# EasyEDA Pro project 物联网底板.eprj, board PCB4
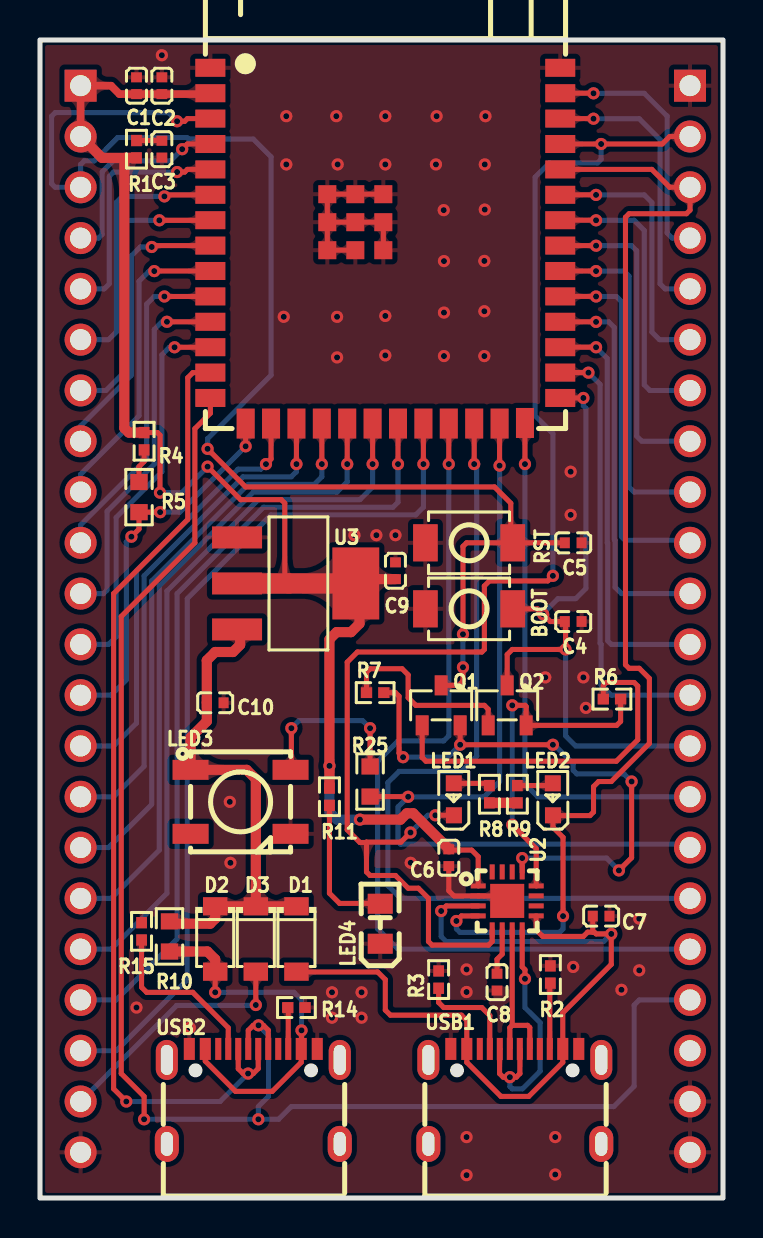
[diagram p4: board, top side]
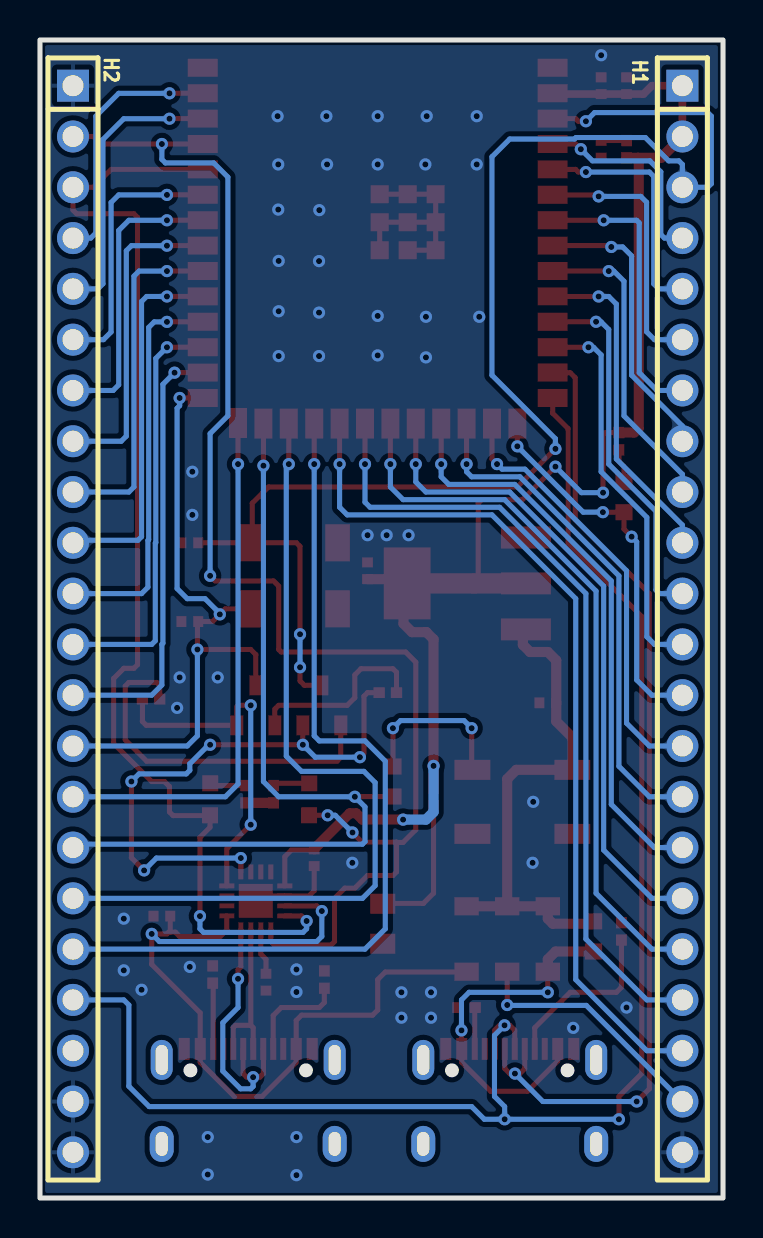
[diagram p5: board, bottom side, seen from below]

Outline 34.16 x 57.91 mm; copper layers: Top Layer, Bottom Layer. Coordinates in mm from the lower left corner of the outline.
Outline path: rectangle 0,57.91 34.16,0
Stack: Top Layer 0.035mm / Dielectric1 1.51mm FR4 er 4.5 / Bottom Layer 0.035mm

## Design rules (mm)
template: JLCPCB Capability(Two Layers Board)
spacing copperThickness1oz (default): track to track 0.102, other pairs 0.152 to 0.3
spacing copperThickness2oz: track to track 0.203, other pairs 0.152 to 0.3
track width copperThickness1oz (default): min 0.127, default 0.254, max 2.54
track width copperThickness2oz: min 0.203, default 0.254, max 2.54
differential pair differentialPair (default): width min 0.127, default 0.254, max 2.54; gap min 0.152, default 0.152
via viaSize (default): diameter min 0.5, default 0.61, max 10; hole min 0.3, default 0.305, max 6.3

## Placement (name value [footprint] x y rotation side)
BOOT  TS-1088-AR02016  [SW-SMD_L3.9-W3.0-P4.45]  21.46 29.46 0 top
C1  10uF  [C0402]  4.83 55.63 270 top
C2  100nF  [C0402]  6.1 55.63 270 top
C3  1uF  [C0402]  6.1 52.45 90 top
C4  100nF  [C0402]  26.67 28.83 180 top
C5  100nF  [C0402]  26.67 32.77 180 top
C6  1uF  [C0402]  20.45 17.02 270 top
C7  1uF  [C0402]  28.07 14.1 180 top
C8  100nF  [C0402]  22.86 10.79 90 top
C9  10uF  [C0402]  17.78 31.37 90 top
C10  10uF  [C0402]  8.76 24.76 180 top
D1  BZT52C12  [SOD-123_L2.7-W1.6-LS3.7-RD]  12.83 12.95 270 top
D2  BZT52C12  [SOD-123_L2.7-W1.6-LS3.7-RD]  8.76 12.95 270 top
D3  BZT52C12  [SOD-123_L2.7-W1.6-LS3.7-RD]  10.79 12.95 270 top
H1  HC-PZ254-11.5L-1x22PZ  [HDR-TH_22P-P2.54-V-M]  2.03 28.96 270 bottom
H2  HC-PZ254-11.5L-1x22PZ  [HDR-TH_22P-P2.54-V-M]  32.51 28.96 270 bottom
LED1  XL-1608UWC-04  [LED0603-RD_WHITE]  20.7 19.94 90 top
LED2  XL-1608UWC-04  [LED0603-RD_WHITE]  25.65 19.94 90 top
LED3  WS2812B-V5/W  [LED-SMD_4P-L5.0-W5.0-TL-1]  10.03 19.81 0 top
LED4  XL-2012SURC  [LED0805-RD_RED]  17.02 13.72 90 top
Q1  SS8050-G(RANGE:120-200)  [SOT-23-3_L2.9-W1.3-P1.90-LS2.4-BR]  20.07 24.64 270 top
Q2  SS8050-G(RANGE:120-200)  [SOT-23-3_L2.9-W1.3-P1.90-LS2.4-BR]  23.37 24.64 270 top
R1  10kΩ  [R0402]  4.83 52.45 270 top
R2  5.1kΩ  [R0402]  25.53 11.18 90 top
R3  5.1kΩ  [R0402]  19.94 10.92 90 top
R4  10kΩ  [R0402]  5.21 37.85 90 top
R5  0Ω  [R0603]  4.95 35.05 90 top
R6  10kΩ  [R0402]  28.61 24.95 0 top
R7  10kΩ  [R0402]  16.76 25.27 0 top
R8  1kΩ  [R0402]  22.48 20.19 270 top
R9  1kΩ  [R0402]  23.88 20.19 270 top
R10  0Ω  [R0603]  6.48 13.08 270 top
R11  1kΩ  [R0402]  14.48 20.07 270 top
R14  5.1kΩ  [R0402]  12.83 9.52 0 top
R15  5.1kΩ  [R0402]  5.08 13.33 90 top
R25  0Ω  [R0603]  16.51 20.83 270 top
RST  TS-1088-AR02016  [SW-SMD_L3.9-W3.0-P4.45]  21.46 32.77 0 top
U1  2.4GHz  [WIRELM-SMD_ESP32-S3-WROOM-1]  17.27 47.62 0 top
U2  CH343P  [TQFN-16_L3.0-W3.0-P0.50-BL-EP1.7]  23.37 14.86 270 top
U3  CJ6109A33GW  [SOT-223-3_L6.5-W3.4-P2.30-LS7.0-BR]  12.83 30.73 180 top
USB1  TYPE-C 16PIN 2MD(073)  [USB-C-SMD_TYPE-C-16PIN-2MD-073]  23.75 5.08 0 top
USB2  TYPE-C 16PIN 2MD(073)  [USB-C-SMD_TYPE-C-16PIN-2MD-073]  10.67 5.08 0 top

## Footprints (pads in the part's own frame, mm; a bottom-side part is the same pattern mirrored in y, then rotated)
C0402
  rect 0.5x0.54 smd: 1(-0.42,0) 2(0.42,0)
HDR-TH_22P-P2.54-V-M
  rect 1.6x1.6 hole 1.05: 1(-26.67,0)
  round 1.6 hole 1.05: 2(-24.13,0) 3(-21.59,0) 4(-19.05,0) 5(-16.51,0) 6(-13.97,0) 7(-11.43,0) 8(-8.89,0) 9(-6.35,0) 10(-3.81,0) 11(-1.27,0) 12(1.27,0) 13(3.81,0) 14(6.35,0) 15(8.89,0) 16(11.43,0) 17(13.97,0) 18(16.51,0) 19(19.05,0) 20(21.59,0) 21(24.13,0) 22(26.67,0)
LED0603-RD_WHITE
  rect 0.8x0.8 smd: 1(-0.799,-0.004) 2(0.799,0.004)
LED0805-RD_RED
  rect 1x1.25 smd: 1(-1,0) 2(1,0)
LED-SMD_4P-L5.0-W5.0-TL-1
  rect 1.8x1 smd: 1(-2.5,1.6) 2(-2.5,-1.6) 3(2.5,-1.6) 4(2.5,1.6)
R0402
  rect 0.566x0.54 smd: 1(-0.433,0) 2(0.433,0)
R0603
  rect 0.806x0.864 smd: 1(-0.753,0) 2(0.753,0)
SOD-123_L2.7-W1.6-LS3.7-RD
  rect 0.91x1.22 smd: 1(-1.635,0) 2(1.635,0)
SOT-23-3_L2.9-W1.3-P1.90-LS2.4-BR
  rect 1x0.65 smd: 1(1,-0.95) 2(1,0.95) 3(-1,0)
SOT-223-3_L6.5-W3.4-P2.30-LS7.0-BR
  rect 2.5x1.1 smd: 1(2.97,-2.3) 2(2.97,0) 3(2.97,2.3)
  rect 2.34x3.6 smd: 4(-2.97,0)
SW-SMD_L3.9-W3.0-P4.45
  rect 1.23x1.86 smd: 1(-2.185,0) 2(2.185,0)
TQFN-16_L3.0-W3.0-P0.50-BL-EP1.7
  rect 0.25x0.75 smd: 1(-0.749,-1.45) 2(-0.248,-1.45) 3(0.252,-1.45) 4(0.751,-1.45) 9(0.75,1.45) 10(0.25,1.45) 11(-0.25,1.45) 12(-0.749,1.45)
  rect 0.75x0.25 smd: 5(1.45,-0.75) 6(1.45,-0.25) 7(1.45,0.25) 8(1.45,0.75) 13(-1.45,0.75) 14(-1.45,0.25) 15(-1.45,-0.25) 16(-1.45,-0.75)
  rect 1.7x1.7 smd: 17(0.001,0)
USB-C-SMD_TYPE-C-16PIN-2MD-073
  oval 1.1x2 hole 0.6x1.5: 13(-4.325,1.825) 14(4.325,1.825)
  oval 1.2x1.8 hole 0.6x1.2: 13(-4.325,-2.375) 14(4.325,-2.375)
  rect 0.55x1.1 smd: A1B12(-3.2,2.375) A4B9(-2.4,2.375) B1A12(3.2,2.375) B4A9(2.4,2.375)
  rect 0.3x1.1 smd: A5(-1.25,2.375) A6(-0.25,2.375) A7(0.25,2.375) A8(1.25,2.375) B5(1.75,2.375) B6(0.75,2.375) B7(-0.75,2.375) B8(-1.75,2.375)
WIRELM-SMD_ESP32-S3-WROOM-1
  rect 1.5x0.9 smd: 1(-8.75,8.895) 2(-8.75,7.625) 3(-8.75,6.355) 4(-8.75,5.085) 5(-8.75,3.815) 6(-8.75,2.545) 7(-8.75,1.275) 8(-8.75,0.005) 9(-8.75,-1.265) 10(-8.75,-2.535) 11(-8.75,-3.805) 12(-8.75,-5.075) 13(-8.75,-6.345) 14(-8.75,-7.615) 27(8.75,-7.615) 28(8.75,-6.345) 29(8.75,-5.075) 30(8.75,-3.805) 31(8.75,-2.535) 32(8.75,-1.265) 33(8.75,0.005) 34(8.75,1.275) 35(8.75,2.545) 36(8.75,3.815) 37(8.75,5.085) 38(8.75,6.355) 39(8.75,7.625) 40(8.75,8.895)
  rect 0.9x1.5 smd: 15(-6.985,-8.895) 16(-5.715,-8.895) 17(-4.445,-8.895) 18(-3.175,-8.895) 19(-1.905,-8.895) 20(-0.635,-8.895) 21(0.635,-8.895) 22(1.905,-8.895) 23(3.175,-8.895) 24(4.445,-8.895) 25(5.715,-8.895) 26(6.985,-8.865)
  rect 0.9x0.9 smd: 41(-2.9,2.575) 41(-2.9,1.175) 41(-2.9,-0.225) 41(-1.5,2.575) 41(-1.5,1.175) 41(-1.5,-0.225) 41(-0.1,2.575) 41(-0.1,1.175) 41(-0.1,-0.225)

## Nets
3.3V: C1.2 C2.2 C6.1 C9.1 H1.1 H1.2 R1.2 R4.2 R11.1 U1.2 U2.1 U3.2 U3.4
+5V: C10.2 D1.1 D2.1 D3.1 LED3.1 R10.1 U3.3
GND: BOOT.1 C1.1 C2.1 C3.1 C4.1 C5.1 C6.2 C7.1 C8.1 C9.2 C10.1 H1.22 H2.1 H2.21 H2.22 LED3.3 LED4.1 R2.2 R3.2 R14.2 R15.2 RST.1 U1.1 U1.40 U1.41 U2.2 U2.17 U3.1 USB1.A1B12 USB1.B1A12 USB2.A1B12 USB2.B1A12
VBUSB: C7.2 D1.2 U2.3 U2.9 USB1.A4B9 USB1.B4A9
VCC: R8.2 R9.2
CHIP_UP: C5.2 H1.3 Q1.3 RST.2 U1.3
D+: U2.7 USB1.A6 USB1.B6
D-: U2.8 USB1.A7 USB1.B7
DTR: Q2.2 R6.2 U2.12
GPIO0: BOOT.2 C4.2 H2.14 Q2.3 U1.27
GPIO1: H2.4 U1.39
GPIO2: H2.5 U1.38
GPIO3: H1.13 R5.1 U1.15
GPIO4: H1.4 U1.4
GPIO5: H1.5 U1.5
GPIO6: H1.6 U1.6
GPIO7: H1.7 U1.7
GPIO8: H1.12 U1.12
GPIO9: H1.15 U1.17
GPIO10: H1.16 U1.18
GPIO11: H1.17 U1.19
GPIO12: H1.18 U1.20
GPIO13: H1.19 U1.21
GPIO14: H1.20 U1.22
GPIO15: H1.8 U1.8
GPIO16: H1.9 U1.9
GPIO17: H1.10 U1.10
GPIO18: H1.11 U1.11
GPIO19: U1.13 USB2.A7 USB2.B7
GPIO20: H2.19 U1.14 USB2.A6 USB2.B6
GPIO21: H2.18 U1.23
GPIO35: H2.13 U1.28
GPIO36: H2.12 U1.29
GPIO37: H2.11 U1.30
GPIO38: H2.10 U1.31
GPIO39: H2.9 U1.32
GPIO40: H2.8 U1.33
GPIO41: H2.7 U1.34
GPIO42: H2.6 U1.35
GPIO45: H2.15 U1.26
GPIO46: H1.14 U1.16
GPIO47: H2.17 U1.24
GPIO48: H2.16 R25.2 U1.25
RGB_CTRL: LED3.4 R25.1
RTS: Q1.2 R7.2 U2.13
U0RXD: H2.3 LED2.1 U1.36 U2.4
U0TXD: H2.2 LED1.1 U1.37 U2.5
$1N6628: C3.2 R1.1
$1N6772: R2.1 USB1.B5
$1N6783: R3.1 USB1.A5
$1N6982: R14.1 USB2.B5
$1N6993: R15.1 USB2.A5
$1N7007: D2.2 R10.2 USB2.A4B9 USB2.B4A9
$1N7156: R4.1 R5.2
$1N7240: Q1.1 R6.1
$1N7244: Q2.1 R7.1
$1N7413: LED4.2 R11.2
$1N7631: D3.2 H1.21
$1N7986: H2.20
$1N8260: LED1.2 R8.1
$1N8264: LED2.2 R9.1
$1N8521: C8.2 U2.6

Pads without a net: LED3 2; U2 10 11 14 15 16; USB1 13 14 A8 B8; USB2 13 14 A8 B8

## Via types
v1: diameter 0.61, hole 0.305, Top Layer to Bottom Layer, 124 vias

## Routing (per net, layer and track width the routed paths; a pad name or vN(x,y) marks a point on that pad's centre or on a via; arc(x,y) is an arc through that point)
3.3V: length 73.3
  Top Layer w0.254: v1(6,35.27) 6,38.15 5.87,38.28 R4.2 ; 12.45,30.73 12.24,30.94 12.24,34.75 12.06,34.92 10.03,34.92 v1(8.38,36.58) ; 20.49,17.4 21.59,17.4 21.92,17.07 U2.1
  Top Layer w0.381: H1.2 H1.1 3.56,55.63 3.98,55.21 C1.2 C2.2 8.48,55.21 U1.2
  Top Layer w0.508: R4.2 4.44,38.28 4.22,38.51 4.22,51.97 4.26,52.02 ; R1.2 4.26,52.02 ; 4.26,52.02 3.1,52.02 H1.2 ; C9.1 16.01,30.95 U3.4 15.98,30.55 15.98,28.72 15.56,28.3 14.84,28.3 14.48,27.94 v1(14.48,21.61) R11.1 ; v1(16,18.92) 18.03,18.92 18.35,19.24 18.67,19.24 20.45,17.46 C6.1
  Top Layer w1.016: 14.91,30.73 U3.2
  Bottom Layer w0.254: v1(6,35.27) 7.08,35.27 v1(8.38,36.58)
  Bottom Layer w0.508: v1(14.48,21.61) 14.48,19.3 14.86,18.92 v1(16,18.92)
+5V: length 25.6
  Top Layer w0.508: R10.1 6.6,13.72 8.51,13.72 8.76,13.97 8.76,14.59 10.79,14.59 ; 10.79,14.59 12.83,14.59 ; 10.79,14.59 10.79,20.95 10.34,21.41 LED3.1 7.53,23.03 8.34,23.84 C10.2 8.34,26.88 8.76,27.3 9.65,27.3 10.01,27.66 10.01,28.28 U3.3
GND: length 15.6
  Top Layer w0.254: U1.41 U1.41 U1.41 U1.41 ; U1.41 U1.41 U1.41 U1.41 ; U1.41 U1.41 U1.41 ; U2.17 23.12,15.11 U2.2 20.71,15.11 20.45,15.37 C6.2
  vias: v1(4.83,9.52) v1(6.1,57.15) v1(7.49,8.51) v1(9.49,19.81) v1(9.52,16.76) v1(12.19,44.07) v1(12.32,54.1) v1(12.32,51.69) v1(14.6,10.29) v1(14.6,9.02) v1(14.82,54.1) v1(14.89,51.69) v1(14.86,44.07) v1(14.86,42.04) v1(15.73,33.15) v1(16.08,10.29) v1(16.08,9.02) v1(16.82,33.15) v1(17.27,54.1) v1(17.27,51.69) v1(17.27,44.11) v1(17.27,42.14) v1(17.78,33.15) v1(18.54,16.76) v1(19.8,51.69) v1(19.84,54.1) v1(20.19,49.4) v1(20.21,46.85) v1(20.21,44.28) v1(20.21,42.11) v1(21.34,11.43) v1(21.34,10.3) v1(21.34,3.05) v1(21.34,1.14) v1(22.28,54.1) v1(22.25,51.69) v1(22.25,49.43) v1(22.22,46.86) v1(22.22,44.35) v1(22.22,42.11) v1(25.27,26.03) v1(25.77,3.05) v1(25.77,1.17) v1(26.54,36.32) v1(26.54,34.16) v1(26.67,11.56) v1(27.18,26.03) v1(27.3,24.51) v1(29.08,10.41) v1(29.97,13.97) v1(29.97,11.39)
VBUSB: length 43.7
  Top Layer w0.254: U2.3 20.32,14.61 v1(20.07,14.35) ; 27.65,13.3 C7.2 ; 27.65,13.3 27.72,13.3 27.81,13.21 v1(28.57,13.21) 28.57,11.68 26.15,9.26 USB1.B4A9 26.15,6.78 24.44,5.08 23.05,5.08 21.35,6.78 USB1.A4B9 21.35,8.88 21.08,9.14 17.53,9.14 17.27,9.4 17.27,10.92 16.89,11.3 12.84,11.3 D1.2 ; 27.65,13.3 27.39,13.3 27.18,13.08 25.15,13.08 24.82,13.41 U2.9
  Bottom Layer w0.254: v1(28.57,13.21) 28.19,12.83 20.32,12.83 20.07,13.08 v1(20.07,14.35)
VCC: length 1.4
  Top Layer w0.508: R8.2 R9.2
CHIP_UP: length 72.1
  Top Layer w0.254: v1(6.86,53.85) 7.24,53.85 7.37,53.98 U1.3 ; Q1.3 20.94,25.64 21.16,25.86 v1(21.16,26.54) ; RST.2 21.34,32.77 21.16,32.59 v1(21.16,28.19) ; RST.2 23.55,32.87 23.55,34.75 22.73,35.56 10.29,35.56 v1(8.38,37.46) ; RST.2 C5.2
  Bottom Layer w0.254: v1(6.86,53.85) 6.42,54.28 0.76,54.28 0.58,54.1 0.58,50.73 0.76,50.55 H1.3 2.03,51.69 2.21,51.87 2.72,51.87 3.89,53.03 7.35,53.03 7.43,52.96 10.67,52.96 11.56,52.07 11.56,41.15 8.38,37.97 v1(8.38,37.46) ; v1(21.16,28.19) v1(21.16,26.54)
D+: length 8
  Top Layer w0.254: 23.62,8.64 24.38,8.64 24.5,8.52 USB1.B6 ; 23.62,8.64 23.62,8.64 U2.7 ; 23.62,8.64 23.5,8.51 USB1.A6
D-: length 13.5
  Top Layer w0.254: USB1.A7 24,7.45 24,6.22 23.82,6.04 v1(23.5,6.04) 23.17,6.04 22.99,6.22 22.99,7.44 USB1.B7 ; U2.8 24.12,11.56 24.26,11.42 v1(24.26,10.96)
  Bottom Layer w0.254: v1(23.5,6.04) 23.5,5.58 23.62,5.46 24.13,5.46 25.02,6.35 25.02,8.76 24.26,9.52 v1(24.26,10.96)
DTR: length 17.1
  Top Layer w0.254: R6.2 29.04,23.83 28.84,23.64 Q2.2 24.32,24.58 24.26,24.64 v1(23.62,24.64) ; U2.12 24.82,17.47 v1(23.62,18.67)
  Bottom Layer w0.254: v1(23.62,18.67) v1(23.62,24.64)
GPIO0: length 32.9
  Top Layer w0.254: BOOT.2 24.89,29.46 v1(25.17,29.19) 25.53,28.83 C4.2 26.29,28.79 v1(26.29,27.43) 23.62,27.43 23.37,27.18 Q2.3 ; U1.27 v1(27.18,40.01)
  Bottom Layer w0.254: H2.14 26.8,22.61 26.29,23.11 v1(26.29,27.43) ; v1(27.18,40.01) 27.18,39.62 27.3,39.5 27.3,30.48 26.8,29.97 25.91,29.97 25.21,29.27
GPIO1: length 12.9
  Top Layer w0.254: U1.39 27.68,55.25 v1(27.69,55.24)
  Bottom Layer w0.254: H2.4 31.62,48.01 31.37,48.26 31.37,54.1 30.23,55.24 v1(27.69,55.24)
GPIO2: length 14.2
  Top Layer w0.254: U1.38 27.68,53.98 v1(27.69,53.97)
  Bottom Layer w0.254: H2.5 31.27,45.47 31.01,45.72 31.01,52.93 29.97,53.97 v1(27.69,53.97)
GPIO3: length 19.1
  Top Layer w0.254: v1(4.57,33.07) 4.95,33.45 R5.1 v1(6.01,34.3) ; v1(10.29,37.59) U1.15
  Bottom Layer w0.254: v1(6.01,34.3) 6.99,34.3 v1(10.29,37.59) ; v1(4.57,33.07) 4.32,32.82 4.32,25.91 3.56,25.15 H1.13
GPIO4: length 10.3
  Top Layer w0.254: U1.4 7.37,52.71 v1(7.11,52.45)
  Bottom Layer w0.254: v1(7.11,52.45) 6.53,51.87 3.66,51.87 3.11,51.32 3.11,48.19 2.93,48.01 H1.4
GPIO5: length 12.1
  Top Layer w0.254: v1(6.86,51.31) 7.24,51.31 7.37,51.44 U1.5
  Bottom Layer w0.254: v1(6.86,51.31) 3.68,51.31 3.47,51.09 3.47,45.72 3.21,45.47 H1.5
GPIO6: length 13.3
  Top Layer w0.254: v1(6.22,50.09) 6.3,50.16 8.52,50.16 U1.6
  Bottom Layer w0.254: H1.6 3.43,42.93 3.82,43.32 3.82,49.8 4.12,50.09 v1(6.22,50.09)
GPIO7: length 14.4
  Top Layer w0.254: U1.7 8.52,48.89 v1(5.97,48.89)
  Bottom Layer w0.254: H1.7 3.3,40.39 4.19,41.27 4.19,48.77 4.32,48.89 v1(5.97,48.89)
GPIO8: length 19.6
  Top Layer w0.254: U1.12 8.52,42.54 v1(6.73,42.54)
  Bottom Layer w0.254: H1.12 3.43,27.69 3.81,28.07 3.81,34.04 6.1,36.32 6.1,42.16 6.48,42.54 v1(6.73,42.54)
GPIO9: length 25.5
  Top Layer w0.254: U1.17 v1(12.83,36.7)
  Bottom Layer w0.254: H1.15 3.68,20.07 5.21,21.59 5.21,31.11 10.16,36.07 12.57,36.07 12.83,36.32 v1(12.83,36.7)
GPIO10: length 29
  Top Layer w0.254: U1.18 v1(14.1,36.7)
  Bottom Layer w0.254: v1(14.1,36.7) 14.1,36.07 13.72,35.69 10.41,35.69 5.59,30.86 5.59,19.68 3.43,17.53 H1.16
GPIO11: length 32.6
  Top Layer w0.254: U1.19 v1(15.37,36.7)
  Bottom Layer w0.254: v1(15.37,36.7) 15.37,35.81 14.86,35.31 10.67,35.31 5.97,30.61 5.97,17.4 3.56,14.99 H1.17
GPIO12: length 36.2
  Top Layer w0.254: U1.20 v1(16.64,36.7)
  Bottom Layer w0.254: H1.18 3.56,12.45 6.35,15.24 6.35,30.35 10.92,34.92 16,34.92 16.64,35.56 v1(16.64,36.7)
GPIO13: length 40.2
  Top Layer w0.254: U1.21 v1(17.91,36.7)
  Bottom Layer w0.254: H1.19 3.81,9.91 6.86,12.95 6.86,30.23 11.18,34.54 17.65,34.54 17.91,34.8 v1(17.91,36.7)
GPIO14: length 43.7
  Top Layer w0.254: U1.22 v1(19.18,36.7)
  Bottom Layer w0.254: v1(19.18,36.7) 19.18,34.54 18.8,34.16 11.56,34.16 7.37,29.97 7.37,10.92 3.81,7.37 H1.20
GPIO15: length 14.5
  Top Layer w0.254: U1.8 5.66,47.63 v1(5.59,47.56)
  Bottom Layer w0.254: H1.8 2.03,38.61 4.57,41.15 4.57,47.12 5.02,47.56 v1(5.59,47.56)
GPIO16: length 15.5
  Top Layer w0.254: v1(5.72,46.35) 5.72,46.36 U1.9
  Bottom Layer w0.254: H1.9 2.03,36.19 4.95,39.12 4.95,45.85 5.46,46.35 v1(5.72,46.35)
GPIO17: length 16.7
  Top Layer w0.254: v1(6.22,45.08) 8.52,45.08 U1.10
  Bottom Layer w0.254: v1(6.22,45.08) 5.72,45.08 5.33,44.7 5.33,36.96 2.03,33.65 H1.10
GPIO18: length 18.4
  Top Layer w0.254: v1(6.35,43.82) U1.11
  Bottom Layer w0.254: H1.11 3.17,30.23 3.35,30.41 3.35,34.34 5.72,36.7 5.72,43.43 6.1,43.82 v1(6.35,43.82)
GPIO19: length 49.1
  Top Layer w0.254: USB2.A7 10.92,6.47 10.67,6.22 10.16,6.22 9.92,6.46 USB2.B7 ; v1(4.32,4.83) 3.68,5.46 3.68,30.23 7.39,33.93 7.39,41.02 7.64,41.27 8.52,41.27 U1.13
  Bottom Layer w0.254: v1(10.41,6.22) 9.01,4.83 v1(4.32,4.83)
GPIO20: length 78.7
  Top Layer w0.254: USB2.B6 11.42,8.39 11.18,8.64 10.67,8.64 10.42,8.39 USB2.A6 ; v1(5.21,3.94) 5.21,5.08 4.06,6.22 4.06,29.08 7.75,32.77 7.75,38.47 8.52,39.25 U1.14
  Bottom Layer w0.254: v1(10.92,3.94) 11.94,3.94 12.57,4.57 28.7,4.57 29.72,5.59 29.72,9.65 29.97,9.91 H2.19 ; v1(10.92,3.94) 10.92,4.57 11.43,5.08 11.43,8.13 v1(10.93,8.64) ; v1(10.92,3.94) v1(5.21,3.94)
GPIO21: length 44.1
  Top Layer w0.254: U1.23 v1(20.45,36.7)
  Bottom Layer w0.254: v1(20.45,36.7) 20.45,23.11 20.19,22.86 17.91,22.86 16.89,21.84 16.89,13.46 17.91,12.45 H2.18
GPIO35: length 22
  Top Layer w0.254: v1(27.43,41.27) 27.43,41.28 U1.28
  Bottom Layer w0.254: H2.13 28.57,25.15 28.07,25.65 28.07,27.69 28.01,27.74 28.01,40.69 v1(27.43,41.27)
GPIO36: length 20.9
  Top Layer w0.254: U1.29 27.81,42.55 v1(27.81,42.54)
  Bottom Layer w0.254: H2.12 28.57,27.69 28.4,27.87 28.4,32.75 28.37,32.78 28.37,41.99 v1(27.81,42.54)
GPIO37: length 19.7
  Top Layer w0.254: U1.30 27.81,43.82 v1(27.81,43.81)
  Bottom Layer w0.254: v1(27.81,43.81) 28.45,43.81 28.73,43.54 28.73,32.92 28.77,32.89 28.77,30.54 29.08,30.23 H2.11
GPIO38: length 18.5
  Top Layer w0.254: U1.31 27.81,45.09 v1(27.81,45.08)
  Bottom Layer w0.254: H2.10 32.38,32.89 29.26,32.89 29.08,33.07 29.08,44.83 28.83,45.08 v1(27.81,45.08)
GPIO39: length 17.2
  Top Layer w0.254: U1.32 27.81,46.36 v1(27.81,46.35)
  Bottom Layer w0.254: v1(27.81,46.35) 29.21,46.35 29.46,46.1 29.46,35.56 29.72,35.31 H2.9
GPIO40: length 16
  Top Layer w0.254: U1.33 27.81,47.63 v1(27.81,47.62)
  Bottom Layer w0.254: H2.8 30.1,37.85 29.84,38.1 29.84,47.37 29.59,47.62 v1(27.81,47.62)
GPIO41: length 14.5
  Top Layer w0.254: v1(27.81,48.89) 27.81,48.9 U1.34
  Bottom Layer w0.254: v1(27.81,48.89) 29.72,48.89 30.23,48.39 30.23,40.66 30.5,40.39 H2.7
GPIO42: length 13.3
  Top Layer w0.254: U1.35 27.81,50.17 v1(27.81,50.16)
  Bottom Layer w0.254: v1(27.81,50.16) 30.23,50.16 30.61,49.78 30.61,43.31 30.99,42.93 H2.6
GPIO45: length 26.6
  Top Layer w0.254: U1.26 v1(24.26,36.7)
  Bottom Layer w0.254: H2.15 24.89,20.07 24.26,20.7 v1(24.26,36.7)
GPIO46: length 21.7
  Top Layer w0.254: v1(11.3,36.7) 11.56,36.96 U1.16
  Bottom Layer w0.254: H1.14 3.68,22.61 4.83,23.75 4.83,31.37 9.91,36.45 11.05,36.45 v1(11.3,36.7)
GPIO47: length 42.2
  Top Layer w0.254: U1.24 v1(21.72,36.7)
  Bottom Layer w0.254: v1(21.72,36.7) 21.84,36.58 21.84,22.1 21.08,21.34 17.96,21.34 17.4,20.78 17.4,15.62 18.03,14.99 H2.17
GPIO48: length 41.9
  Top Layer w0.254: R25.2 18.41,20.07 v1(18.41,20.07) ; U1.25 v1(22.99,36.62)
  Bottom Layer w0.254: v1(22.99,36.62) 22.99,20.83 22.22,20.07 v1(18.41,20.07) 17.91,19.56 17.91,17.82 18.03,17.69 32.34,17.69 H2.16
RGB_CTRL: length 8.3
  Top Layer w0.254: LED3.4 12.57,21.45 v1(12.57,23.49) ; R25.1 v1(16.51,23.49)
  Bottom Layer w0.254: v1(16.51,23.49) 16.13,23.88 12.95,23.88 v1(12.57,23.49)
RTS: length 28.1
  Top Layer w0.254: R7.2 17.78,25.27 17.96,25.09 17.96,22.25 v1(18.16,22.05) ; Q1.2 v1(21.02,22.67) v1(25.65,22.67) ; v1(29.59,20.83) 29.59,17.02 v1(28.96,16.38) ; 24.12,16.31 v1(24.12,17)
  Bottom Layer w0.254: v1(28.96,16.38) 28.34,17 v1(24.12,17) ; v1(25.65,22.67) 25.72,22.67 26.67,21.72 26.67,21.39 26.85,21.21 29.21,21.21 v1(29.59,20.83) ; v1(21.02,22.67) 20.39,22.05 v1(18.16,22.05)
U0RXD: length 58.5
  Top Layer w0.254: U2.4 21.08,14.11 v1(20.83,13.85) ; v1(26.16,14.1) 26.16,18.03 25.66,18.54 LED2.1 25.67,19.12 27.51,19.12 27.69,19.3 27.69,20.57 27.94,20.83 28.57,20.83 30.48,22.73 30.48,25.98 29.97,26.49 29.46,26.49 29.28,26.67 29.28,49.04 29.46,49.22 32.33,49.22 32.51,49.4 H2.3 31.5,50.55 30.6,51.44 U1.36
  Bottom Layer w0.254: v1(20.83,13.85) 20.83,13.46 21.01,13.28 25.98,13.28 26.16,13.46 v1(26.16,14.1)
U0TXD: length 71.1
  Top Layer w0.254: H2.2 31.5,53.09 31.12,52.71 v1(28.07,52.71) U1.37 ; v1(19.77,19.14) LED1.1 ; v1(18.53,18.28) 18.05,17.8 16.33,17.8 ; 16.33,17.8 16.33,16.31 16.51,16.13 17.78,16.13 18.41,15.49 18.92,15.49 19.43,14.99 19.43,12.83 19.61,12.65 22.44,12.65 22.62,12.83 U2.5 ; 16.33,17.8 16.31,17.78 16,17.78 15.37,18.41 15.37,26.8 15.88,27.3 22.1,27.3 22.22,27.43 22.22,30.61 22.48,30.86 25.4,30.86 v1(25.65,31.11)
  Bottom Layer w0.254: v1(25.65,31.11) 25.65,38.23 24.76,39.12 24.76,51.05 25.47,51.76 27.89,51.76 28.07,51.94 v1(28.07,52.71) ; v1(19.77,19.14) 19.39,19.14 v1(18.53,18.28)
$1N6628: length 1.3
  Top Layer w0.254: C3.2 6.08,52.88 R1.1
$1N6772: length 3.3
  Top Layer w0.254: R2.1 25.5,10.72 USB1.B5
$1N6783: length 5.2
  Top Layer w0.254: USB1.A5 22.5,9.12 22.1,9.52 20.19,9.52 19.94,9.78 19.94,10.49
$1N6982: length 2.1
  Top Layer w0.254: USB2.B5 12.42,9.5 R14.1
$1N6993: length 8.6
  Top Layer w0.254: USB2.A5 9.42,8.51 7.64,10.29 5.33,10.29 5.08,10.54 R15.1
$1N7007: length 18.3
  Top Layer w0.254: D2.2 v1(8.76,10.29) ; v1(13.08,8.38) 13.08,7.47 USB2.B4A9 13.07,6.78 11.62,5.33 9.78,5.33 8.27,6.84 USB2.A4B9
  Top Layer w0.508: R10.2 8.37,12.33 8.76,11.94 D2.2
  Bottom Layer w0.254: v1(13.08,8.38) 13.08,9.91 12.7,10.29 v1(8.76,10.29)
$1N7156: length 1.7
  Top Layer w0.254: R5.2 4.95,36.58 5.21,36.83 R4.1
$1N7240: length 18.1
  Top Layer w0.254: R6.1 28.17,25.63 28.32,25.78 29.72,25.78 29.9,25.6 29.9,22.91 28.83,21.84 19.3,21.84 19.12,22.03 Q1.1
$1N7244: length 9.5
  Top Layer w0.254: Q2.1 22.42,24.44 22.22,24.64 18.8,24.64 18.41,25.02 18.41,26.16 18.11,26.47 16.51,26.47 16.33,26.29 R7.1
$1N7413: length 7.2
  Top Layer w0.254: LED4.2 17,14.73 14.99,14.73 14.48,15.24 R11.2
$1N7631: length 12.4
  Top Layer w0.254: D3.2 v1(10.79,9.65)
  Bottom Layer w0.254: H1.21 6.84,9.63 10.77,9.63 v1(10.79,9.65)
$1N8260: length 1.8
  Top Layer w0.254: R8.1 22.37,20.74 LED1.2
$1N8264: length 1.8
  Top Layer w0.254: R9.1 25.54,20.63 LED2.2
$1N8521: length 2.3
  Top Layer w0.254: C8.2 22.86,11.94 23.12,12.2 U2.6

## Copper pours and planes (outline as drawn; the poured copper is in the pictures)
GND on Top Layer: -0.76,58.93 34.92,58.93 34.92,-1.02 -0.76,-1.02
GND on Bottom Layer: -0.38,58.55 34.92,58.55 34.92,-1.02 -0.38,-1.02

Small or netless copper shapes (teardrops, artwork), in the pictures only: 217 on Top Layer, 100 on Bottom Layer
